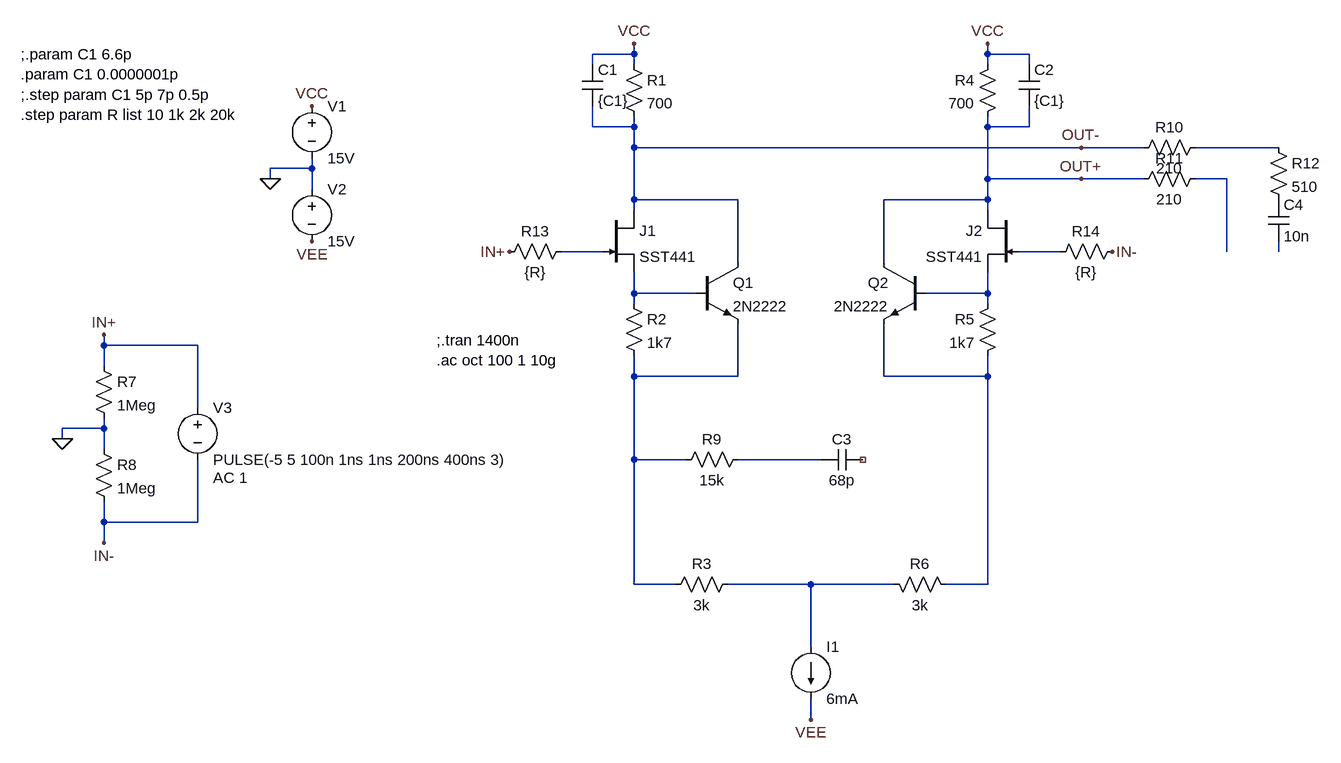
[diagram p0: schematic long_tailed_pair.asc]
long_tailed_pair.asc, the LTspice schematic file:
Version 4
SHEET 1 1268 944
WIRE 176 -192 176 -208
WIRE 176 -192 112 -192
WIRE 720 -192 720 -208
WIRE 784 -192 720 -192
WIRE 112 -176 112 -192
WIRE 176 -176 176 -192
WIRE 720 -176 720 -192
WIRE 784 -176 784 -192
WIRE 112 -80 112 -112
WIRE 176 -80 176 -96
WIRE 176 -80 112 -80
WIRE 720 -80 720 -96
WIRE 784 -80 784 -112
WIRE 784 -80 720 -80
WIRE 176 -48 176 -80
WIRE 864 -48 176 -48
WIRE 960 -48 864 -48
WIRE 1168 -48 1040 -48
WIRE -320 -16 -320 -32
WIRE -320 -16 -384 -16
WIRE -384 0 -384 -16
WIRE 720 0 720 -80
WIRE 864 0 720 0
WIRE 960 0 864 0
WIRE 1088 0 1040 0
WIRE -320 16 -320 -16
WIRE 176 32 176 -48
WIRE 336 32 176 32
WIRE 720 32 720 0
WIRE 720 32 560 32
WIRE 176 48 176 32
WIRE 720 48 720 32
WIRE 128 112 64 112
WIRE 832 112 768 112
WIRE 1088 112 1088 0
WIRE 1168 112 1168 96
WIRE 336 128 336 32
WIRE 560 128 560 32
WIRE 176 176 176 144
WIRE 272 176 176 176
WIRE 720 176 720 144
WIRE 720 176 624 176
WIRE 176 192 176 176
WIRE 720 192 720 176
WIRE -640 256 -640 240
WIRE -496 256 -640 256
WIRE -640 288 -640 256
WIRE 176 304 176 272
WIRE 336 304 336 224
WIRE 336 304 176 304
WIRE 560 304 560 224
WIRE 720 304 720 272
WIRE 720 304 560 304
WIRE -496 352 -496 256
WIRE -640 384 -640 368
WIRE -640 384 -704 384
WIRE -704 400 -704 384
WIRE -640 416 -640 384
WIRE 176 432 176 304
WIRE 256 432 176 432
WIRE 464 432 336 432
WIRE -640 528 -640 496
WIRE -496 528 -496 432
WIRE -496 528 -640 528
WIRE -640 560 -640 528
WIRE 176 624 176 432
WIRE 240 624 176 624
WIRE 448 624 320 624
WIRE 576 624 448 624
WIRE 720 624 720 304
WIRE 720 624 656 624
WIRE 448 720 448 624
WIRE 448 832 448 800
FLAG -384 0 0
FLAG -320 -112 VCC
FLAG -320 96 VEE
FLAG 176 -208 VCC
FLAG 448 832 VEE
FLAG -16 112 IN+
FLAG 720 -208 VCC
FLAG 912 112 IN-
FLAG -640 240 IN+
FLAG -704 400 0
FLAG 864 0 OUT+
FLAG 864 -48 OUT-
FLAG -640 560 IN-
SYMBOL njf 128 48 R0
SYMATTR InstName J1
SYMATTR Value SST441
SYMBOL res 160 -192 R0
SYMATTR InstName R1
SYMATTR Value 700
SYMBOL res 160 176 R0
SYMATTR InstName R2
SYMATTR Value 1k7
SYMBOL res 224 640 R270
WINDOW 0 32 56 VTop 2
WINDOW 3 0 56 VBottom 2
SYMATTR InstName R3
SYMATTR Value 3k
SYMBOL current 448 720 R0
WINDOW 123 0 0 Left 0
WINDOW 39 0 0 Left 0
SYMATTR InstName I1
SYMATTR Value 6mA
SYMBOL voltage -320 -128 R0
WINDOW 123 0 0 Left 0
WINDOW 39 0 0 Left 0
SYMATTR InstName V1
SYMATTR Value 15V
SYMBOL voltage -320 0 R0
WINDOW 123 0 0 Left 0
WINDOW 39 0 0 Left 0
SYMATTR InstName V2
SYMATTR Value 15V
SYMBOL npn 272 128 R0
SYMATTR InstName Q1
SYMATTR Value 2N2222
SYMBOL njf 768 48 M0
SYMATTR InstName J2
SYMATTR Value SST441
SYMBOL res 736 -192 M0
SYMATTR InstName R4
SYMATTR Value 700
SYMBOL res 736 176 M0
SYMATTR InstName R5
SYMATTR Value 1k7
SYMBOL res 672 640 M270
WINDOW 0 32 56 VTop 2
WINDOW 3 0 56 VBottom 2
SYMATTR InstName R6
SYMATTR Value 3k
SYMBOL npn 624 128 M0
SYMATTR InstName Q2
SYMATTR Value 2N2222
SYMBOL voltage -496 336 R0
WINDOW 123 24 124 Left 2
WINDOW 39 0 0 Left 0
SYMATTR Value2 AC 1
SYMATTR InstName V3
SYMATTR Value PULSE(-5 5 100n 1ns 1ns 200ns 400ns 3)
SYMBOL cap 96 -176 R0
SYMATTR InstName C1
SYMATTR Value {C1}
SYMBOL cap 768 -176 R0
SYMATTR InstName C2
SYMATTR Value {C1}
SYMBOL res -656 272 R0
SYMATTR InstName R7
SYMATTR Value 1Meg
SYMBOL res -656 400 R0
SYMATTR InstName R8
SYMATTR Value 1Meg
SYMBOL res 352 416 R90
WINDOW 0 0 56 VBottom 2
WINDOW 3 32 56 VTop 2
SYMATTR InstName R9
SYMATTR Value 15k
SYMBOL cap 528 416 R90
WINDOW 0 0 32 VBottom 2
WINDOW 3 32 32 VTop 2
SYMATTR InstName C3
SYMATTR Value 68p
SYMBOL res 1056 -64 R90
WINDOW 0 0 56 VBottom 2
WINDOW 3 32 56 VTop 2
SYMATTR InstName R10
SYMATTR Value 210
SYMBOL res 1056 -16 R90
WINDOW 0 0 56 VBottom 2
WINDOW 3 32 56 VTop 2
SYMATTR InstName R11
SYMATTR Value 210
SYMBOL res 1152 -64 R0
SYMATTR InstName R12
SYMATTR Value 510
SYMBOL cap 1152 32 R0
SYMATTR InstName C4
SYMATTR Value 10n
SYMBOL res 80 96 R90
WINDOW 0 0 56 VBottom 2
WINDOW 3 32 56 VTop 2
SYMATTR InstName R13
SYMATTR Value {R}
SYMBOL res 928 96 R90
WINDOW 0 0 56 VBottom 2
WINDOW 3 32 56 VTop 2
SYMATTR InstName R14
SYMATTR Value {R}
TEXT -128 248 Left 2 !;.tran 1400n\n.ac oct 100 1 10g
TEXT -768 -192 Left 2 !;.param C1 6.6p\n.param C1 0.0000001p\n;.step param C1 5p 7p 0.5p\n.step param R list 10 1k 2k 20k

The netlist it stands for:
* long_tailed_pair.asc
J1 OUT- N003 N006 SST441
R1 VCC OUT- 700
R2 N006 N008 1k7
R3 N008 N011 3k
I1 N011 VEE 6mA
V1 VCC 0 15V
V2 0 VEE 15V
Q1 OUT- N006 N008 0 2N2222
J2 OUT+ N004 N007 SST441
R4 VCC OUT+ 700
R5 N007 N009 1k7
R6 N009 N011 3k
Q2 OUT+ N007 N009 0 2N2222
V3 IN+ IN- PULSE(-5 5 100n 1ns 1ns 200ns 400ns 3) AC 1
C1 VCC OUT- {C1}
C2 VCC OUT+ {C1}
R7 IN+ 0 1Meg
R8 0 IN- 1Meg
R9 N010 N008 15k
C3 NC_01 N010 68p
R10 N001 OUT- 210
R11 N002 OUT+ 210
R12 N001 P001 510
C4 P001 N005 10n
R13 N003 IN+ {R}
R14 IN- N004 {R}
.model NPN NPN
.model PNP PNP
.lib standard.bjt
.model NJF NJF
.model PJF PJF
.lib standard.jft
;.tran 1400n
.ac oct 100 1 10g
;.param C1 6.6p
.param C1 0.0000001p
;.step param C1 5p 7p 0.5p
.step param R list 10 1k 2k 20k
.backanno
.end